# Altium project Lab4_Altium_Files.PrjPcb (part 3 of 3)

## Sheet Mem_IS43TR16256A.SchDoc
size 594 x 420 mm; SheetNumber: 9; SheetTotal: 9
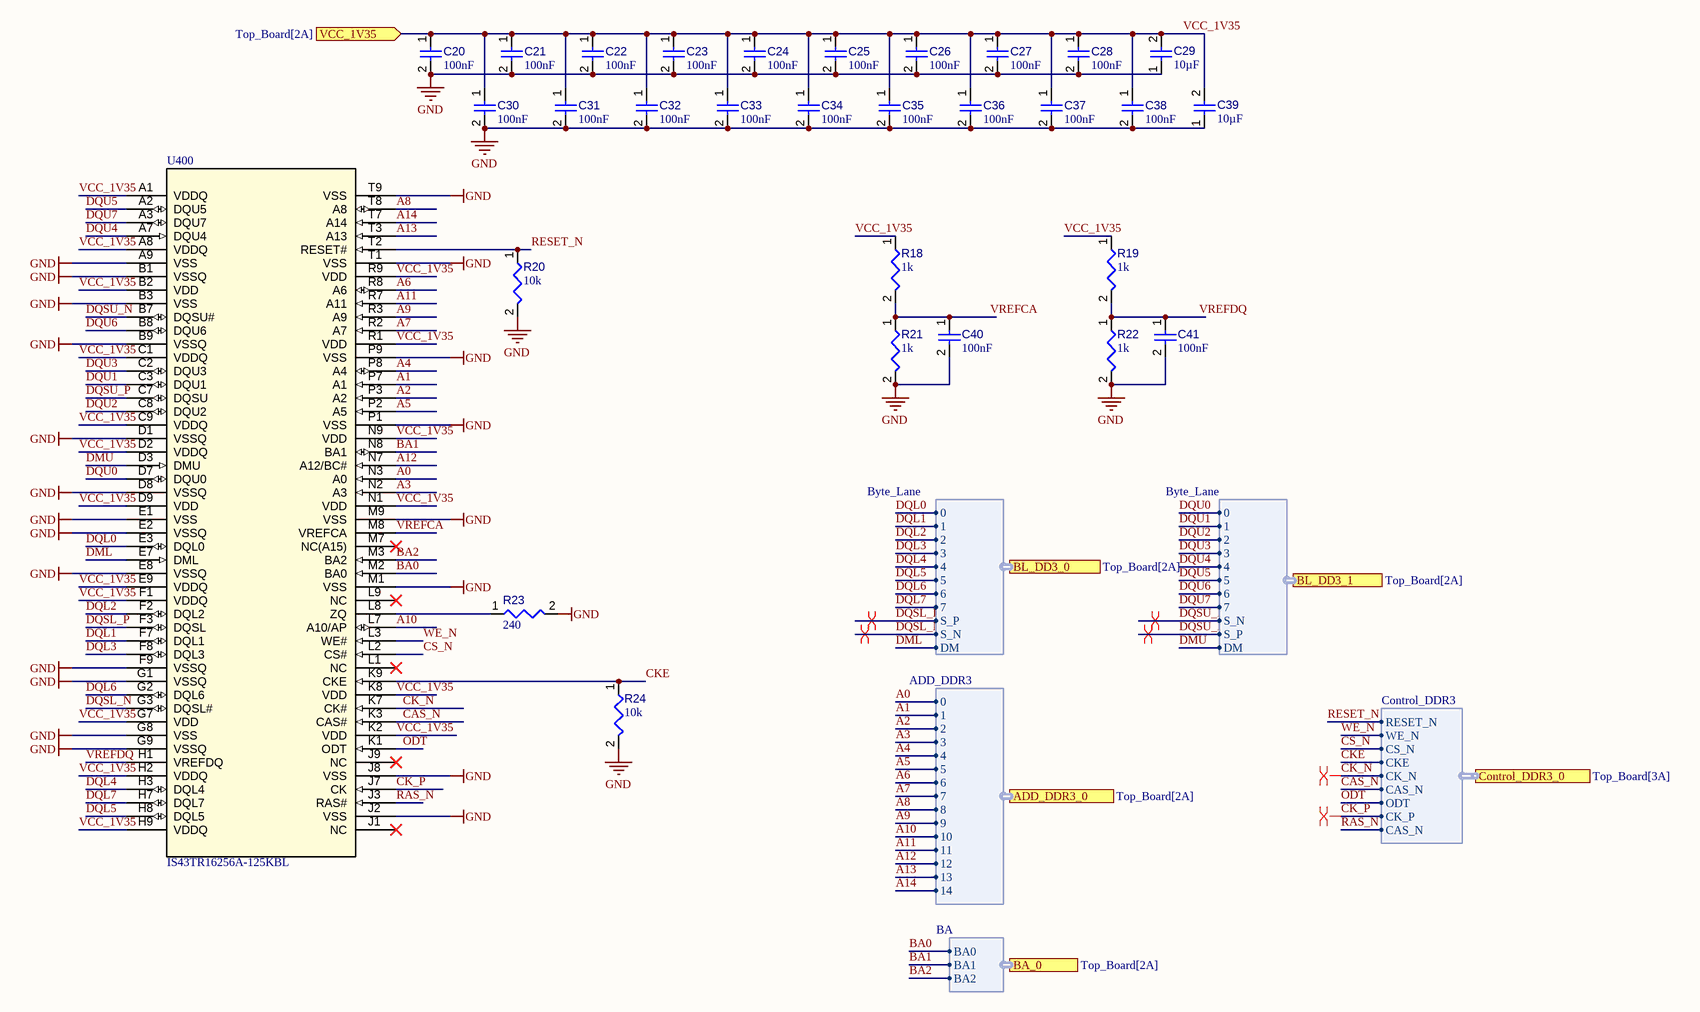
[diagram p9: Mem_IS43TR16256A.SchDoc]

### Parts
C20  value 100nF  [CAPC0402(1005)60_L]  (hidden comment: Capacitor 100nF +/-20% 50V 0402)
C21  value 100nF  [CAPC0402(1005)60_L]  (hidden comment: Capacitor 100nF +/-20% 50V 0402)
C22  value 100nF  [CAPC0402(1005)60_L]  (hidden comment: Capacitor 100nF +/-20% 50V 0402)
C23  value 100nF  [CAPC0402(1005)60_L]  (hidden comment: Capacitor 100nF +/-20% 50V 0402)
C24  value 100nF  [CAPC0402(1005)60_L]  (hidden comment: Capacitor 100nF +/-20% 50V 0402)
C25  value 100nF  [CAPC0402(1005)60_L]  (hidden comment: Capacitor 100nF +/-20% 50V 0402)
C26  value 100nF  [CAPC0402(1005)60_L]  (hidden comment: Capacitor 100nF +/-20% 50V 0402)
C27  value 100nF  [CAPC0402(1005)60_L]  (hidden comment: Capacitor 100nF +/-20% 50V 0402)
C28  value 100nF  [CAPC0402(1005)60_L]  (hidden comment: Capacitor 100nF +/-20% 50V 0402)
C29  value 10µF  [CAPC0805(2012)145_L]  (hidden comment: Capacitor 10µF +/-20% 25V 0805)
C30  value 100nF  [CAPC0402(1005)60_L]  (hidden comment: Capacitor 100nF +/-20% 50V 0402)
C31  value 100nF  [CAPC0402(1005)60_L]  (hidden comment: Capacitor 100nF +/-20% 50V 0402)
C32  value 100nF  [CAPC0402(1005)60_L]  (hidden comment: Capacitor 100nF +/-20% 50V 0402)
C33  value 100nF  [CAPC0402(1005)60_L]  (hidden comment: Capacitor 100nF +/-20% 50V 0402)
C34  value 100nF  [CAPC0402(1005)60_L]  (hidden comment: Capacitor 100nF +/-20% 50V 0402)
C35  value 100nF  [CAPC0402(1005)60_L]  (hidden comment: Capacitor 100nF +/-20% 50V 0402)
C36  value 100nF  [CAPC0402(1005)60_L]  (hidden comment: Capacitor 100nF +/-20% 50V 0402)
C37  value 100nF  [CAPC0402(1005)60_L]  (hidden comment: Capacitor 100nF +/-20% 50V 0402)
C38  value 100nF  [CAPC0402(1005)60_L]  (hidden comment: Capacitor 100nF +/-20% 50V 0402)
C39  value 10µF  [CAPC0805(2012)145_L]  (hidden comment: Capacitor 10µF +/-20% 25V 0805)
C40  value 100nF  [CAPC0402(1005)60_L]  (hidden comment: Capacitor 100nF +/-20% 50V 0402)
C41  value 100nF  [CAPC0402(1005)60_L]  (hidden comment: Capacitor 100nF +/-20% 50V 0402)
R18  value 1k  [RESC0805(2012)_L]  (hidden comment: Resistor 1K +/-5% 0805 125 mW)
R19  value 1k  [RESC0805(2012)_L]  (hidden comment: Resistor 1K +/-5% 0805 125 mW)
R20  value 10k  [RESC2013X50X35ML15T15]  (hidden comment: Resistor 10k +/-1% 0805 125 mW)
R21  value 1k  [RESC0805(2012)_L]  (hidden comment: Resistor 1K +/-5% 0805 125 mW)
R22  value 1k  [RESC0805(2012)_L]  (hidden comment: Resistor 1K +/-5% 0805 125 mW)
R23  value 240  [RESC0402(1005)_L]  (hidden comment: 240R2J)
R24  value 10k  [RESC2013X50X35ML15T15]  (hidden comment: Resistor 10k +/-1% 0805 125 mW)
U400  IS43TR16256A-125KBL  [BGA96_IS43TR_ISI]

### Ports
ADD_DDR3_0 (harness ADD_DDR3, see Top_Board[2A]), BA_0 (harness BA, see Top_Board[2A]), BL_DD3_0 (harness Byte_Lane, see Top_Board[2A]), BL_DD3_1 (harness Byte_Lane, see Top_Board[2A]), Control_DDR3_0 (harness Control_DDR3, see Top_Board[3A]), VCC_1V35 (in, see Top_Board[2A])

### Harnesses
Byte_Lane: 0, 2, 3, 4, 7, 1, 6, S_P, S_N, 5, DM
Byte_Lane: 0, 1, 2, 3, 4, 5, 6, 7, S_N, S_P, DM
ADD_DDR3: 1, 2, 3, 4, 6, 5, 7, 8, 9, 11, 10, 12, 13, 0, 14
BA: BA0, BA1, BA2
Control_DDR3: RESET_N, WE_N, CS_N, CKE, CK_N, CAS_N, ODT, CK_P, CAS_N

### Nets
GND: C20.2 C21.2 C22.2 C23.2 C24.2 C25.2 C26.2 C27.2 C28.2 C29.1 C30.2 C31.2 C32.2 C33.2 C34.2 C35.2 C36.2 C37.2 C38.2 C39.1 C40.2 C41.2 R20.2 R21.2 R22.2 R23.2 R24.2 U400.A9(VSS) U400.B1(VSSQ) U400.B3(VSS) U400.B9(VSSQ) U400.D1(VSSQ) U400.D8(VSSQ) U400.E1(VSS) U400.E2(VSSQ) U400.E8(VSSQ) U400.F9(VSSQ) U400.G1(VSSQ) U400.G8(VSS) U400.G9(VSSQ) U400.J2(VSS) U400.J8(VSS) U400.M1(VSS) U400.M9(VSS) U400.P1(VSS) U400.P9(VSS) U400.T1(VSS) U400.T9(VSS)
A0: U400.N3(A0) ; port ADD_DDR3_0.0
A1: U400.P7(A1) ; port ADD_DDR3_0.1
A2: U400.P3(A2) ; port ADD_DDR3_0.2
A3: U400.N2(A3) ; port ADD_DDR3_0.3
A4: U400.P8(A4) ; port ADD_DDR3_0.4
A5: U400.P2(A5) ; port ADD_DDR3_0.5
A6: U400.R8(A6) ; port ADD_DDR3_0.6
A7: U400.R2(A7) ; port ADD_DDR3_0.7
A8: U400.T8(A8) ; port ADD_DDR3_0.8
A9: U400.R3(A9) ; port ADD_DDR3_0.9
A10: U400.L7(A10/AP) ; port ADD_DDR3_0.10
A11: U400.R7(A11) ; port ADD_DDR3_0.11
A12: U400.N7(A12/BC#) ; port ADD_DDR3_0.12
A13: U400.T3(A13) ; port ADD_DDR3_0.13
A14: U400.T7(A14) ; port ADD_DDR3_0.14
BA0: U400.M2(BA0) ; port BA_0.BA0
BA1: U400.N8(BA1) ; port BA_0.BA1
BA2: U400.M3(BA2) ; port BA_0.BA2
CAS_N: U400.J3(RAS#) U400.K3(CAS#) ; port Control_DDR3_0.CAS_N  [also labelled RAS_N]
CK_N: U400.K7(CK#) ; port Control_DDR3_0.CK_N
CK_P: U400.J7(CK) ; port Control_DDR3_0.CK_P
CKE: R24.1 U400.K9(CKE) ; port Control_DDR3_0.CKE
CS_N: U400.L2(CS#) ; port Control_DDR3_0.CS_N  [project net Control_DDR3_A.CS_N]
DML: U400.E7(DML) ; port BL_DD3_0.DM  [project net BL_A.DM]
DMU: U400.D3(DMU) ; port BL_DD3_1.DM  [project net BL_B.DM]
DQL0: U400.E3(DQL0) ; port BL_DD3_0.0  [project net BL_A.0]
DQL1: U400.F7(DQL1) ; port BL_DD3_0.1  [project net BL_A.1]
DQL2: U400.F2(DQL2) ; port BL_DD3_0.2  [project net BL_A.2]
DQL3: U400.F8(DQL3) ; port BL_DD3_0.3  [project net BL_A.3]
DQL4: U400.H3(DQL4) ; port BL_DD3_0.4  [project net BL_A.4]
DQL5: U400.H8(DQL5) ; port BL_DD3_0.5  [project net BL_A.5]
DQL6: U400.G2(DQL6) ; port BL_DD3_0.6  [project net BL_A.6]
DQL7: U400.H7(DQL7) ; port BL_DD3_0.7  [project net BL_A.7]
DQSL_N: U400.G3(DQSL#) ; port BL_DD3_0.S_N  [project net BL_A.S_N]
DQSL_P: U400.F3(DQSL) ; port BL_DD3_0.S_P  [project net BL_A.S_P]
DQSU_N: U400.B7(DQSU#) ; port BL_DD3_1.S_P  [project net BL_B.S_P]
DQSU_P: U400.C7(DQSU) ; port BL_DD3_1.S_N  [project net BL_B.S_N]
DQU0: U400.D7(DQU0) ; port BL_DD3_1.0  [project net BL_B.0]
DQU1: U400.C3(DQU1) ; port BL_DD3_1.1  [project net BL_B.1]
DQU2: U400.C8(DQU2) ; port BL_DD3_1.2  [project net BL_B.2]
DQU3: U400.C2(DQU3) ; port BL_DD3_1.3  [project net BL_B.3]
DQU4: U400.A7(DQU4) ; port BL_DD3_1.4  [project net BL_B.4]
DQU5: U400.A2(DQU5) ; port BL_DD3_1.5  [project net BL_B.5]
DQU6: U400.B8(DQU6) ; port BL_DD3_1.6  [project net BL_B.6]
DQU7: U400.A3(DQU7) ; port BL_DD3_1.7  [project net BL_B.7]
ODT: U400.K1(ODT) ; port Control_DDR3_0.ODT  [project net Control_DDR3_A.ODT]
RESET_N: R20.1 U400.T2(RESET#) ; port Control_DDR3_0.RESET_N  [project net Control_DDR3_A.RESET_N]
VCC_1V35: C20.1 C21.1 C22.1 C23.1 C24.1 C25.1 C26.1 C27.1 C28.1 C29.2 C30.1 C31.1 C32.1 C33.1 C34.1 C35.1 C36.1 C37.1 C38.1 C39.2 R18.1 R19.1 U400.A1(VDDQ) U400.A8(VDDQ) U400.B2(VDD) U400.C1(VDDQ) U400.C9(VDDQ) U400.D2(VDDQ) U400.D9(VDD) U400.E9(VDDQ) U400.F1(VDDQ) U400.G7(VDD) U400.H2(VDDQ) U400.H9(VDDQ) U400.K2(VDD) U400.K8(VDD) U400.N1(VDD) U400.N9(VDD) U400.R1(VDD) U400.R9(VDD) ; port VCC_1V35
VREFCA: C40.1 R18.2 R21.1 U400.M8(VREFCA)
VREFDQ: C41.1 R19.2 R22.1 U400.H1(VREFDQ)
WE_N: U400.L3(WE#) ; port Control_DDR3_0.WE_N  [project net Control_DDR3_A.WE_N]
NetR23_1: R23.1 U400.L8(ZQ)

Not connected (* = marked no-connect by the designer): U400 J1(NC)* J9(NC)* L1(NC)* L9(NC)* M7(NC(A15))*

### Layout directives
differential pair: BL_A.S_N, BL_A.S_P, BL_B.S_N, BL_B.S_P, CK_N, CK_P

### Notes on the sheet
- DWG NO:
- REV:
- THIS DOCUMENT AND THE DATA DISCLOSED HEREIN OR
- HEREWITH IS THE PROPERTY OF ALTIUM LIMITED AND MAY
- BE FREELY DISTRIBUTED IN WHOLE. NO RIGHTS ARE
- RESERVED OR EXPRESS OR IMPLIED WARANTEE GIVEN.
- REVISION
- DESCRIPTION
- DATE
- APPROVED
- ENG:
- APPROVALS
- PROJECT
- DSN:
- CHK:
- REFERENCE DOCUMENTS
- PROJECT REVISION:
- TITLE
- DOCUMENT REVISION:
- DESIGN ITEM:
- BOM:
- FAB DWG:
- PCB DWG:
- ASSY DWG:
- SCALE:
- A2
- SIZE
- CAGE CODE
- FILE NAME
- DWG NO.
- SHEET
- OF
- REV

### Library data of the parts
C20-C28 C30-C38 C40 C41 = CMP-001-00067-3: Chip Capacitor, 100nF +/-20%, 50V, 0402, Thickness 0.6 mm; Manufacturer: Murata; Manufacturer Part Number: GRM155R61H104JE14D; Manufacturer: TAIYO YUDEN; Manufacturer Part Number: UMK105B7104KV-FR; Manufacturer: TDK; Manufacturer Part Number: C1005X7R1H104K; Manufacturer: Yageo Group; Manufacturer Part Number: CC0402KRX7R9BB104; Manufacturer Part Number: C1005X6S1H104K050BB; Manufacturer Part Number: CC0402KRX5R9BB104; Manufacturer Part Number: C1005X7R1H104K050BB; Manufacturer Part Number: GRM155R71H104KE14D; Manufacturer: KYOCERA AVX; Manufacturer Part Number: 04025D104KAT2A; Manufacturer Part Number: GCM155L81E104KE02D; Manufacturer Part Number: C1005X5R1H104K; Tolerance: 10%; Min Operating Temperature: -55°C; Pins: 2; Case/Package: 0402; Max Operating Temperature: 85°C; Voltage Rating: 50V; Mounting Technology: SMT; Component Type: Capacitors
C29 C39 = CMP-001-00079-4: Chip Capacitor, 10µF +/-20%, 25V, 0805, Thickness 1.45 mm; Tolerance: 10%; Max Operating Temperature: 85°C; Case/Package: 0805; Voltage Rating: 25V; Min Operating Temperature: -55°C; Mounting Technology: SMT; Pins: 2
R18 R19 R21 R22 = CMP-009-00118-3: Chip Resistor, 1 kOhms, +/-5%, 125 mW, -55 to 155 degC, 0805; Manufacturer: Yageo Group; Manufacturer Part Number: RC0805JR-071KL; Tolerance: 5%; Power: 125mW; Case/Package: 0805; Pins: 2; Min Operating Temperature: -55°C; Max Operating Temperature: 155°C; Component Type: Resistors
R20 R24 = CMP-009-00018-5: Chip Resistor, 10 KOhm, +/- 1%, 125 mW, -55 to 155 degC, 0805 (2012 Metric); Power: 125mW; Voltage Rating: 150V; Tolerance: 1%; Pins: 2; Min Operating Temperature: -55°C; Case/Package: 0805; Max Operating Temperature: 155°C; RoHS Compliant: True; Mounting Technology: SM
R23 = CMP-009-00084-2: 240R 0.063W 5% 0402 (1005 Metric)  SMD; Power: 63mW; Pins: 2; Case/Package: 0402; Mounting Technology: SMT; Tolerance: 5%
U400 = CMP-024-000001-1: No Description Available; Manufacturer_Name: ISSI; Source: IS43TR16256A-125KBL.SchLib; Copyright: Copyright (C) 2026 Ultra Librarian. All rights reserved.; Type: Memory; Design Item ID: IS43TR16256A-125KBL; Manufacturer_Part_Number: IS43TR16256A-125KBL; RefDes: RefDes

## Sheet MTFC32GAPALBH.SchDoc
size A3; SheetNumber: 7; SheetTotal: 9
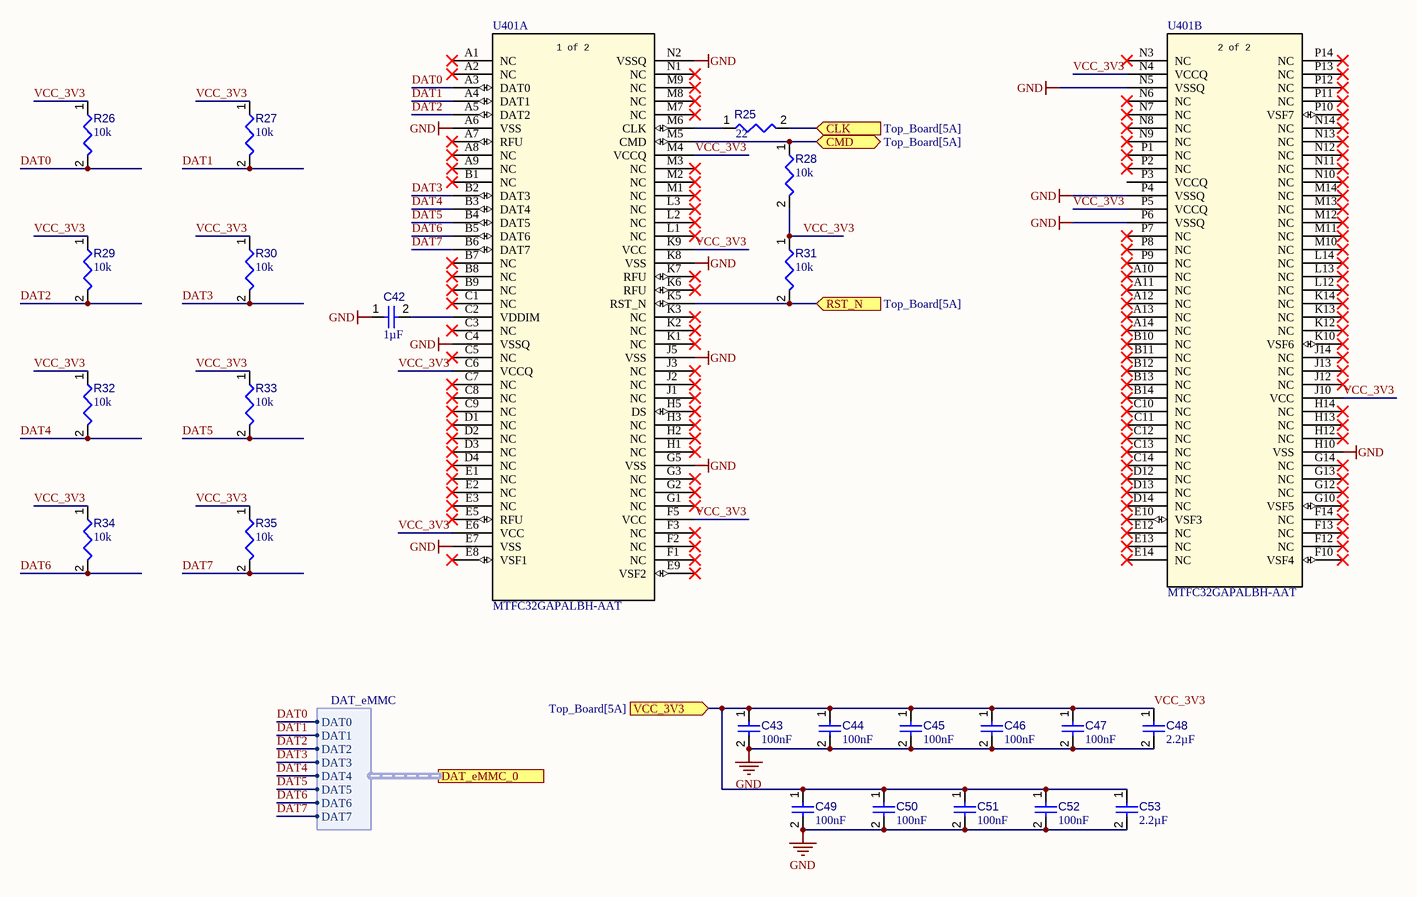
[diagram p10: MTFC32GAPALBH.SchDoc]

### Parts
C42  value 1µF  [CAPC2013X135X45NL10T25]  (hidden comment: Capacitor 1 uF +/- 10% 50 V 0805)
C43  value 100nF  [CAPC2013X95X50LL10T25]  (hidden comment: Capacitor 100 nF +/-10% 50 V 0805)
C44  value 100nF  [CAPC2013X95X50LL10T25]  (hidden comment: Capacitor 100 nF +/-10% 50 V 0805)
C45  value 100nF  [CAPC2013X95X50LL10T25]  (hidden comment: Capacitor 100 nF +/-10% 50 V 0805)
C46  value 100nF  [CAPC2013X95X50LL10T25]  (hidden comment: Capacitor 100 nF +/-10% 50 V 0805)
C47  value 100nF  [CAPC2013X95X50LL10T25]  (hidden comment: Capacitor 100 nF +/-10% 50 V 0805)
C48  value 2.2µF  [CAPC0402(1005)60_L]  (hidden comment: Capacitor 2,2µF +/-20% 10V 0402)
C49  value 100nF  [CAPC2013X95X50LL10T25]  (hidden comment: Capacitor 100 nF +/-10% 50 V 0805)
C50  value 100nF  [CAPC2013X95X50LL10T25]  (hidden comment: Capacitor 100 nF +/-10% 50 V 0805)
C51  value 100nF  [CAPC2013X95X50LL10T25]  (hidden comment: Capacitor 100 nF +/-10% 50 V 0805)
C52  value 100nF  [CAPC2013X95X50LL10T25]  (hidden comment: Capacitor 100 nF +/-10% 50 V 0805)
C53  value 2.2µF  [CAPC0402(1005)60_L]  (hidden comment: Capacitor 2,2µF +/-20% 10V 0402)
R25  value 22  [RESC0402(1005)_L]  (hidden comment: 22R2J)
R26  value 10k  [RESC2013X50X35ML15T15]  (hidden comment: Resistor 10k +/-1% 0805 125 mW)
R27  value 10k  [RESC2013X50X35ML15T15]  (hidden comment: Resistor 10k +/-1% 0805 125 mW)
R28  value 10k  [RESC2013X50X35ML15T15]  (hidden comment: Resistor 10k +/-1% 0805 125 mW)
R29  value 10k  [RESC2013X50X35ML15T15]  (hidden comment: Resistor 10k +/-1% 0805 125 mW)
R30  value 10k  [RESC2013X50X35ML15T15]  (hidden comment: Resistor 10k +/-1% 0805 125 mW)
R31  value 10k  [RESC2013X50X35ML15T15]  (hidden comment: Resistor 10k +/-1% 0805 125 mW)
R32  value 10k  [RESC2013X50X35ML15T15]  (hidden comment: Resistor 10k +/-1% 0805 125 mW)
R33  value 10k  [RESC2013X50X35ML15T15]  (hidden comment: Resistor 10k +/-1% 0805 125 mW)
R34  value 10k  [RESC2013X50X35ML15T15]  (hidden comment: Resistor 10k +/-1% 0805 125 mW)
R35  value 10k  [RESC2013X50X35ML15T15]  (hidden comment: Resistor 10k +/-1% 0805 125 mW)
U401  MTFC32GAPALBH-AAT  [TFBGA153_11P5X13_MRN]  (parts A,B of 2)

### Ports
CLK (in, see Top_Board[5A]), CMD (bidir, see Top_Board[5A]), DAT_eMMC_0 (harness DAT_eMMC), RST_N (in, see Top_Board[5A]), VCC_3V3 (in, see Top_Board[5A])

### Harnesses
DAT_eMMC: DAT0, DAT1, DAT2, DAT3, DAT5, DAT6, DAT7, DAT4

### Nets
GND: C42.1 C43.2 C44.2 C45.2 C46.2 C47.2 C48.2 C49.2 C50.2 C51.2 C52.2 C53.2 U401.A6(VSS) U401.C4(VSSQ) U401.E7(VSS) U401.G5(VSS) U401.H10(VSS) U401.J5(VSS) U401.K8(VSS) U401.N2(VSSQ) U401.N5(VSSQ) U401.P4(VSSQ) U401.P6(VSSQ)
DAT0: R26.2 U401.A3(DAT0) ; port DAT_eMMC_0.DAT0
DAT1: R27.2 U401.A4(DAT1) ; port DAT_eMMC_0.DAT1
DAT2: R29.2 U401.A5(DAT2) ; port DAT_eMMC_0.DAT2
DAT3: R30.2 U401.B2(DAT3) ; port DAT_eMMC_0.DAT3
DAT4: R32.2 U401.B3(DAT4) ; port DAT_eMMC_0.DAT4
DAT5: R33.2 U401.B4(DAT5) ; port DAT_eMMC_0.DAT5
DAT6: R34.2 U401.B5(DAT6) ; port DAT_eMMC_0.DAT6
DAT7: R35.2 U401.B6(DAT7) ; port DAT_eMMC_0.DAT7
eMMC_CLK: R25.2 ; port CLK
eMMC_CMD: R28.1 U401.M5(CMD) ; port CMD
RST_N: R31.2 U401.K5(RST_N) ; port RST_N
VCC_3V3: C43.1 C44.1 C45.1 C46.1 C47.1 C48.1 C49.1 C50.1 C51.1 C52.1 C53.1 R26.1 R27.1 R28.2 R29.1 R30.1 R31.1 R32.1 R33.1 R34.1 R35.1 U401.C6(VCCQ) U401.E6(VCC) U401.F5(VCC) U401.J10(VCC) U401.K9(VCC) U401.M4(VCCQ) U401.N4(VCCQ) U401.P5(VCCQ) ; port VCC_3V3
NetC42_2: C42.2 U401.C2(VDDIM)
NetR25_1: R25.1 U401.M6(CLK)

Not connected (* = marked no-connect by the designer): U401 A1(NC)* A2(NC)* A7(RFU)* A8(NC)* A9(NC)* A10(NC)* A11(NC)* A12(NC)* A13(NC)* A14(NC)* B1(NC)* B7(NC)* B8(NC)* B9(NC)* B10(NC)* B11(NC)* B12(NC)* B13(NC)* B14(NC)* C1(NC)* C3(NC)* C5(NC)* C7(NC)* C8(NC)* C9(NC)* C10(NC)* C11(NC)* C12(NC)* C13(NC)* C14(NC)* D1(NC)* D2(NC)* D3(NC)* D4(NC)* D12(NC)* D13(NC)* D14(NC)* E1(NC)* E2(NC)* E3(NC)* E5(RFU)* E8(VSF1)* E9(VSF2)* E10(VSF3)* E12(NC)* E13(NC)* E14(NC)* F1(NC)* F2(NC)* F3(NC)* F10(VSF4)* F12(NC)* F13(NC)* F14(NC)* G1(NC)* G2(NC)* G3(NC)* G10(VSF5)* G12(NC)* G13(NC)* G14(NC)* H1(NC)* H2(NC)* H3(NC)* H5(DS)* H12(NC)* H13(NC)* H14(NC)* J1(NC)* J2(NC)* J3(NC)* J12(NC)* J13(NC)* J14(NC)* K1(NC)* K2(NC)* K3(NC)* K6(RFU)* K7(RFU)* K10(VSF6)* K12(NC)* K13(NC)* K14(NC)* L1(NC)* L2(NC)* L3(NC)* L12(NC)* L13(NC)* L14(NC)* M1(NC)* M2(NC)* M3(NC)* M7(NC)* M8(NC)* M9(NC)* M10(NC)* M11(NC)* M12(NC)* M13(NC)* M14(NC)* N1(NC)* N3(NC)* N6(NC)* N7(NC)* N8(NC)* N9(NC)* N10(NC)* N11(NC)* N12(NC)* N13(NC)* N14(NC)* P1(NC)* P2(NC)* P3(VCCQ) P7(NC)* P8(NC)* P9(NC)* P10(VSF7)* P11(NC)* P12(NC)* P13(NC)* P14(NC)*

### Notes on the sheet
- (in symbol CMP-034-000000-1, part A) 1 of 2
- (in symbol CMP-034-000000-1, part B) 2 of 2

### Library data of the parts
C42 = CMP-001-00007-6: Chip Capacitor, 1 uF, +/- 10%, 50 V, 0805 (2012 Metric); Manufacturer: TDK; Manufacturer Part Number: C2012X7R1H105K125AB; Manufacturer: Murata; Manufacturer Part Number: GRM21BR71H105KA12L; Manufacturer: Kyocera / AVX; Manufacturer Part Number: 08055C105KAT2A; Capacitor Type: Ceramic; Voltage Rating: 50V; Min Operating Temperature: -55°C; RoHS Compliant: True; Mounting Technology: SM; Case/Package: 0805; Max Operating Temperature: 125°C; Tolerance: 10%; Pins: 2; Component Type: Capacitors
C43-C47 C49-C52 = CMP-001-00018-6: Chip Capacitor, 100 nF, +/- 10%, 50 V, 0805 (2012 Metric); Manufacturer: Yageo Group; Manufacturer Part Number: CC0805KRX7R9BB104; Manufacturer: Murata; Manufacturer Part Number: GRM21BR71H104KA01L; Capacitor Type: Ceramic; Voltage Rating: 50V; Pins: 2; Max Operating Temperature: 125°C; Min Operating Temperature: -55°C; Mounting Technology: SM; Case/Package: 0805; RoHS Compliant: True; Tolerance: 10%; Component Type: Capacitors
C48 C53 = CMP-001-00056-4: Chip Capacitor, 2,2µF +/-20%, 10V, 0402, Thickness 0.6 mm; Manufacturer: Samsung Electro-Mechanics; Manufacturer Part Number: CL05A225KP7NSB8; Manufacturer: Murata; Manufacturer Part Number: GRM155R61C225KE11D; Manufacturer: TDK; Manufacturer Part Number: C1005X5R1A225K; Manufacturer Part Number: GRM155R61A225KE95D; Manufacturer Part Number: GRM155R61C225KE44D; Manufacturer Part Number: GRT155R61E225KE13D; Tolerance: 10%; Mounting Technology: SMT; Max Operating Temperature: 85°C; Case/Package: 0402; Pins: 2; Min Operating Temperature: -55°C; Voltage Rating: 10V; Component Type: Capacitors
R25 = CMP-009-00082-2: 22R 0.063W 5% 0402 (1005 Metric)  SMD; Power: 63mW; Tolerance: 5%; Case/Package: 0402; Pins: 2; Mounting Technology: SMT
R26-R35 = CMP-009-00018-5: Chip Resistor, 10 KOhm, +/- 1%, 125 mW, -55 to 155 degC, 0805 (2012 Metric); Manufacturer: Yageo Group; Manufacturer Part Number: RC0805FR-0710KL; Manufacturer: Vishay; Manufacturer Part Number: CRCW080510K0FKEA; Manufacturer: Panasonic / Panasonic ECG; Manufacturer Part Number: ERJ-6ENF1002V; Power: 125mW; Voltage Rating: 150V; Tolerance: 1%; Pins: 2; Min Operating Temperature: -55°C; Case/Package: 0805; Max Operating Temperature: 155°C; RoHS Compliant: True; Mounting Technology: SM; Component Type: Resistors
U401 = CMP-034-000000-1: No Description Available; Manufacturer_Name: Micron; Copyright: Copyright (C) 2026 Ultra Librarian. All rights reserved.; Type: Type; Manufacturer_Part_Number: MTFC32GAPALBH-AAT; RefDes: RefDes; Design Item ID: MTFC32GAPALBH-AAT; Source: MTFC32GAPALBH-AAT.SchLib

## Sheet MR4A16BCYS35R.SchDoc
size A3; SheetNumber: 6; SheetTotal: 10
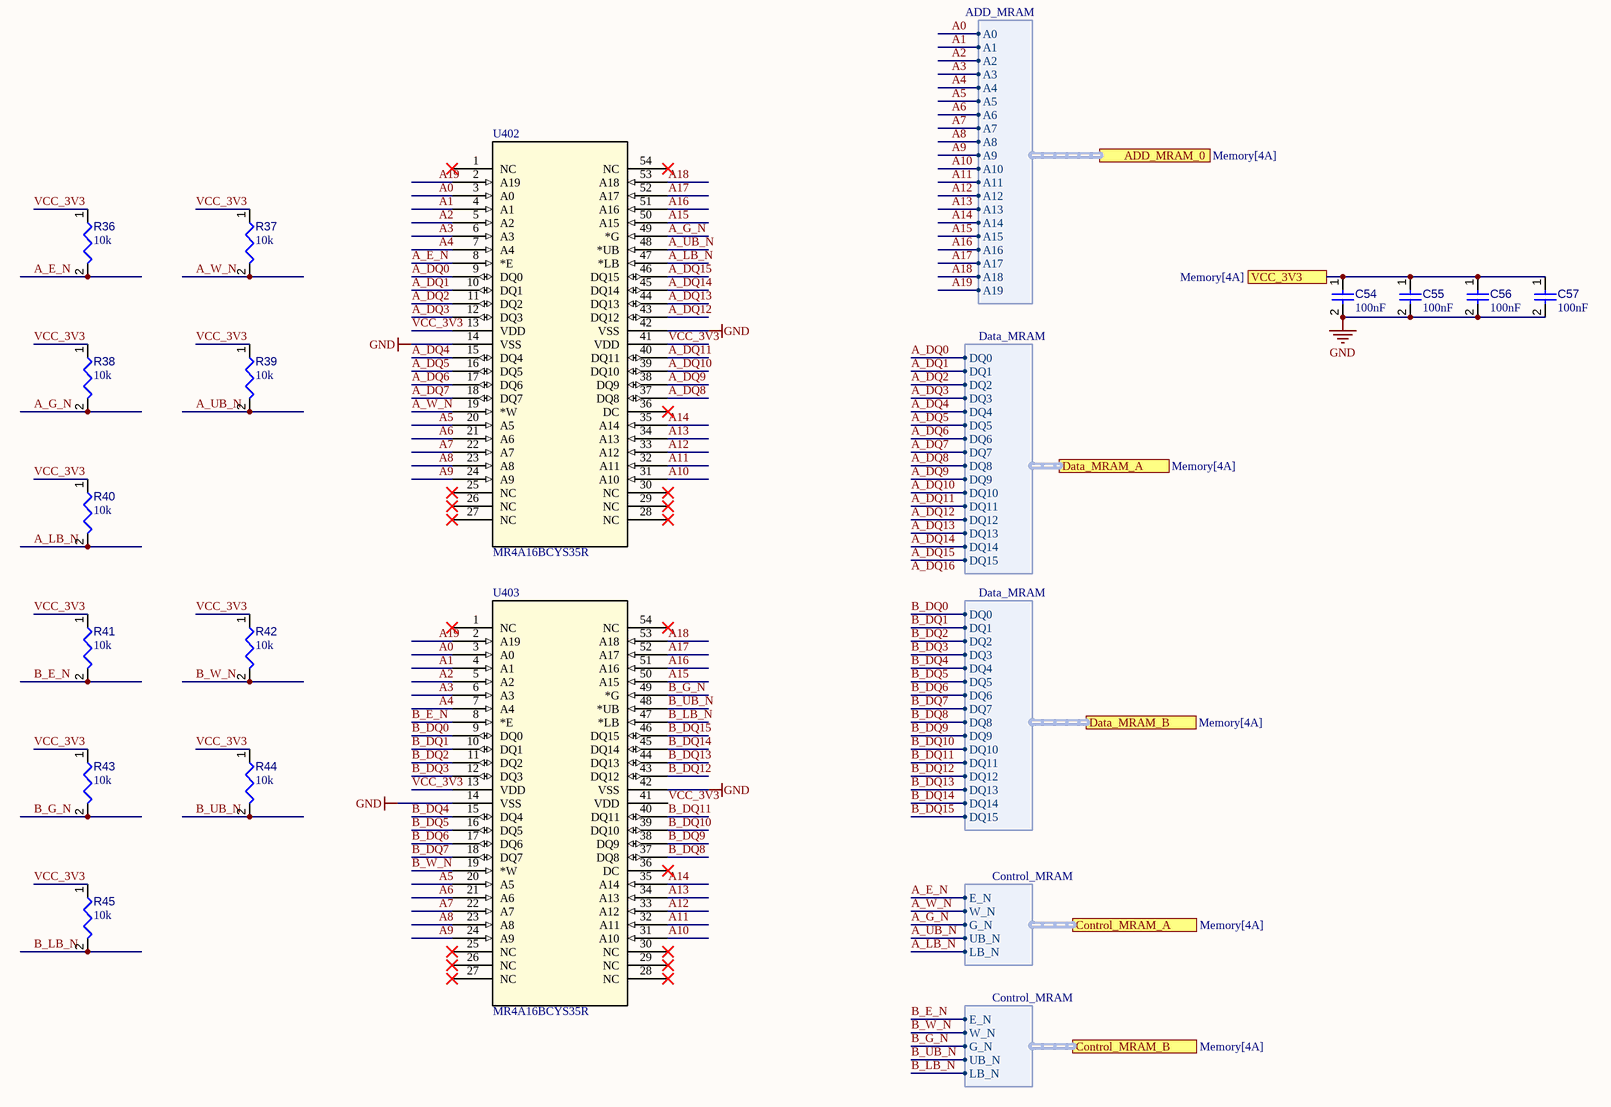
[diagram p11: MR4A16BCYS35R.SchDoc]

### Parts
C54  value 100nF  [CAPC2013X95X50LL10T25]  (hidden comment: Capacitor 100 nF +/-10% 50 V 0805)
C55  value 100nF  [CAPC2013X95X50LL10T25]  (hidden comment: Capacitor 100 nF +/-10% 50 V 0805)
C56  value 100nF  [CAPC2013X95X50LL10T25]  (hidden comment: Capacitor 100 nF +/-10% 50 V 0805)
C57  value 100nF  [CAPC2013X95X50LL10T25]  (hidden comment: Capacitor 100 nF +/-10% 50 V 0805)
R36  value 10k  [RESC2013X50X35ML15T15]  (hidden comment: Resistor 10k +/-1% 0805 125 mW)
R37  value 10k  [RESC2013X50X35ML15T15]  (hidden comment: Resistor 10k +/-1% 0805 125 mW)
R38  value 10k  [RESC2013X50X35ML15T15]  (hidden comment: Resistor 10k +/-1% 0805 125 mW)
R39  value 10k  [RESC2013X50X35ML15T15]  (hidden comment: Resistor 10k +/-1% 0805 125 mW)
R40  value 10k  [RESC2013X50X35ML15T15]  (hidden comment: Resistor 10k +/-1% 0805 125 mW)
R41  value 10k  [RESC2013X50X35ML15T15]  (hidden comment: Resistor 10k +/-1% 0805 125 mW)
R42  value 10k  [RESC2013X50X35ML15T15]  (hidden comment: Resistor 10k +/-1% 0805 125 mW)
R43  value 10k  [RESC2013X50X35ML15T15]  (hidden comment: Resistor 10k +/-1% 0805 125 mW)
R44  value 10k  [RESC2013X50X35ML15T15]  (hidden comment: Resistor 10k +/-1% 0805 125 mW)
R45  value 10k  [RESC2013X50X35ML15T15]  (hidden comment: Resistor 10k +/-1% 0805 125 mW)
U402  MR4A16BCYS35R  [TSOP2-54_EVS]
U403  MR4A16BCYS35R  [TSOP2-54_EVS]

### Ports
ADD_MRAM_0 (harness ADD_MRAM, see Memory[4A]), Control_MRAM_A (harness Control_MRAM, see Memory[4A]), Control_MRAM_B (harness Control_MRAM, see Memory[4A]), Data_MRAM_A (harness Data_MRAM, see Memory[4A]), Data_MRAM_B (harness Data_MRAM, see Memory[4A]), VCC_3V3 (see Memory[4A])

### Harnesses
ADD_MRAM: A0, A1, A2, A3, A4, A5, A6, A7, A8, A9, A10, A11, A12, A13, A14, A15, A16, A17, A18, A19
Data_MRAM: DQ0, DQ1, DQ2, DQ3, DQ4, DQ5, DQ6, DQ7, DQ8, DQ9, DQ10, DQ11, DQ12, DQ13, DQ14, DQ15
Control_MRAM: E_N, W_N, G_N, LB_N, UB_N

### Nets
GND: C54.2 C55.2 C56.2 C57.2 U402.14(VSS) U402.42(VSS) U403.14(VSS) U403.42(VSS)
A0: U402.3(A0) U403.3(A0) ; port ADD_MRAM_0.A0
A1: U402.4(A1) U403.4(A1) ; port ADD_MRAM_0.A1
A2: U402.5(A2) U403.5(A2) ; port ADD_MRAM_0.A2
A3: U402.6(A3) U403.6(A3) ; port ADD_MRAM_0.A3
A4: U402.7(A4) U403.7(A4) ; port ADD_MRAM_0.A4
A5: U402.20(A5) U403.20(A5) ; port ADD_MRAM_0.A5
A6: U402.21(A6) U403.21(A6) ; port ADD_MRAM_0.A6
A7: U402.22(A7) U403.22(A7) ; port ADD_MRAM_0.A7
A8: U402.23(A8) U403.23(A8) ; port ADD_MRAM_0.A8
A9: U402.24(A9) U403.24(A9) ; port ADD_MRAM_0.A9
A10: U402.31(A10) U403.31(A10) ; port ADD_MRAM_0.A10
A11: U402.32(A11) U403.32(A11) ; port ADD_MRAM_0.A11
A12: U402.33(A12) U403.33(A12) ; port ADD_MRAM_0.A12
A13: U402.34(A13) U403.34(A13) ; port ADD_MRAM_0.A13
A14: U402.35(A14) U403.35(A14) ; port ADD_MRAM_0.A14
A15: U402.50(A15) U403.50(A15) ; port ADD_MRAM_0.A15
A16: U402.51(A16) U403.51(A16) ; port ADD_MRAM_0.A16
A17: U402.52(A17) U403.52(A17) ; port ADD_MRAM_0.A17
A18: U402.53(A18) U403.53(A18) ; port ADD_MRAM_0.A18
A19: U402.2(A19) U403.2(A19) ; port ADD_MRAM_0.A19
A_DQ0: U402.9(DQ0) ; port Data_MRAM_A.DQ0
A_DQ1: U402.10(DQ1) ; port Data_MRAM_A.DQ1
A_DQ2: U402.11(DQ2) ; port Data_MRAM_A.DQ2
A_DQ3: U402.12(DQ3) ; port Data_MRAM_A.DQ3
A_DQ4: U402.15(DQ4) ; port Data_MRAM_A.DQ4
A_DQ5: U402.16(DQ5) ; port Data_MRAM_A.DQ5
A_DQ6: U402.17(DQ6) ; port Data_MRAM_A.DQ6
A_DQ7: U402.18(DQ7) ; port Data_MRAM_A.DQ7
A_DQ8: U402.37(DQ8) ; port Data_MRAM_A.DQ8
A_DQ9: U402.38(DQ9) ; port Data_MRAM_A.DQ9
A_DQ10: U402.39(DQ10) ; port Data_MRAM_A.DQ10
A_DQ11: U402.40(DQ11) ; port Data_MRAM_A.DQ11
A_DQ12: U402.43(DQ12) ; port Data_MRAM_A.DQ12
A_DQ13: U402.44(DQ13) ; port Data_MRAM_A.DQ13
A_DQ14: U402.45(DQ14) ; port Data_MRAM_A.DQ14
A_DQ15: U402.46(DQ15) ; port Data_MRAM_A.DQ15
A_E_N: R36.2 R41.2 U402.8(*E) U403.8(*E) ; port Control_MRAM_A.E_N  [also labelled B_E_N]
A_G_N: R38.2 R43.2 U402.49(*G) U403.49(*G) ; port Control_MRAM_A.G_N  [also labelled B_G_N]
A_LB_N: R40.2 R45.2 U402.47(*LB) U403.47(*LB) ; port Control_MRAM_A.LB_N  [also labelled B_LB_N]
A_UB_N: R39.2 R44.2 U402.48(*UB) U403.48(*UB) ; port Control_MRAM_A.UB_N  [also labelled B_UB_N]
A_W_N: R37.2 R42.2 U402.19(*W) U403.19(*W) ; port Control_MRAM_A.W_N  [also labelled B_W_N]
B_DQ0: U403.9(DQ0) ; port Data_MRAM_B.DQ0
B_DQ1: U403.10(DQ1) ; port Data_MRAM_B.DQ1
B_DQ2: U403.11(DQ2) ; port Data_MRAM_B.DQ2
B_DQ3: U403.12(DQ3) ; port Data_MRAM_B.DQ3
B_DQ4: U403.15(DQ4) ; port Data_MRAM_B.DQ4
B_DQ5: U403.16(DQ5) ; port Data_MRAM_B.DQ5
B_DQ6: U403.17(DQ6) ; port Data_MRAM_B.DQ6
B_DQ7: U403.18(DQ7) ; port Data_MRAM_B.DQ7
B_DQ8: U403.37(DQ8) ; port Data_MRAM_B.DQ8
B_DQ9: U403.38(DQ9) ; port Data_MRAM_B.DQ9
B_DQ10: U403.39(DQ10) ; port Data_MRAM_B.DQ10
B_DQ11: U403.40(DQ11) ; port Data_MRAM_B.DQ11
B_DQ12: U403.43(DQ12) ; port Data_MRAM_B.DQ12
B_DQ13: U403.44(DQ13) ; port Data_MRAM_B.DQ13
B_DQ14: U403.45(DQ14) ; port Data_MRAM_B.DQ14
B_DQ15: U403.46(DQ15) ; port Data_MRAM_B.DQ15
VCC_3V3: R36.1 R37.1 R38.1 R39.1 R40.1 R41.1 R42.1 R43.1 R44.1 R45.1 U402.13(VDD) U402.41(VDD) U403.13(VDD) U403.41(VDD)
NetC54_1: C54.1 C55.1 C56.1 C57.1 ; port VCC_3V3

Not connected (* = marked no-connect by the designer): U402 1(NC)* 25(NC)* 26(NC)* 27(NC)* 28(NC)* 29(NC)* 30(NC)* 36(DC)* 54(NC)*; U403 1(NC)* 25(NC)* 26(NC)* 27(NC)* 28(NC)* 29(NC)* 30(NC)* 36(DC)* 54(NC)*

### Notes on the sheet
- Labels drawn without touching a wire or pin: A_DQ16

### Library data of the parts
C54-C57 = CMP-001-00018-6: Chip Capacitor, 100 nF, +/- 10%, 50 V, 0805 (2012 Metric); Capacitor Type: Ceramic; Voltage Rating: 50V; Pins: 2; Max Operating Temperature: 125°C; Min Operating Temperature: -55°C; Mounting Technology: SM; Case/Package: 0805; RoHS Compliant: True; Tolerance: 10%
R36-R45 = CMP-009-00018-5: as R26 on sheet MTFC32GAPALBH; Tolerance: 1%; Pins: 2; Min Operating Temperature: -55°C; Case/Package: 0805; Max Operating Temperature: 155°C; RoHS Compliant: True; Mounting Technology: SM; Component Type: Resistors
U402 U403 = CMP-022-000000-1: No Description Available; Manufacturer_Name: Everspin; Copyright: Copyright (C) 2026 Ultra Librarian. All rights reserved.; Type: Type; Manufacturer_Part_Number: MR4A16BCYS35R; RefDes: RefDes; Design Item ID: MR4A16BCYS35R; Source: MR4A16BCYS35R.SchLib

## Nets that join several sheets
GND: Soc_SmartFusion2 (11 pins), UHF (32 pins), S_Band (96 pins), Power (35 pins), Mem_IS43TR16256A (48 pins), MTFC32GAPALBH (23 pins), MR4A16BCYS35R (8 pins)
A0: Soc_SmartFusion2 (U16.B17), Mem_IS43TR16256A (U400.N3)
A0: Soc_SmartFusion2 (U16.D1), MR4A16BCYS35R (U402.3 U403.3)
A1: Soc_SmartFusion2 (U16.D2), MR4A16BCYS35R (U402.4 U403.4)
A1: Soc_SmartFusion2 (U16.D16), Mem_IS43TR16256A (U400.P7)
A2: Soc_SmartFusion2 (U16.D3), MR4A16BCYS35R (U402.5 U403.5)
A2: Soc_SmartFusion2 (U16.E16), Mem_IS43TR16256A (U400.P3)
A3: Soc_SmartFusion2 (U16.C17), Mem_IS43TR16256A (U400.N2)
A3: Soc_SmartFusion2 (U16.D4), MR4A16BCYS35R (U402.6 U403.6)
A4: Soc_SmartFusion2 (U16.C18), Mem_IS43TR16256A (U400.P8)
A4: Soc_SmartFusion2 (U16.D5), MR4A16BCYS35R (U402.7 U403.7)
A5: Soc_SmartFusion2 (U16.B19), Mem_IS43TR16256A (U400.P2)
A5: Soc_SmartFusion2 (U16.E1), MR4A16BCYS35R (U402.20 U403.20)
A6: Soc_SmartFusion2 (U16.A20), Mem_IS43TR16256A (U400.R8)
A6: Soc_SmartFusion2 (U16.E2), MR4A16BCYS35R (U402.21 U403.21)
A7: Soc_SmartFusion2 (U16.C19), Mem_IS43TR16256A (U400.R2)
A7: Soc_SmartFusion2 (U16.E4), MR4A16BCYS35R (U402.22 U403.22)
A8: Soc_SmartFusion2 (U16.E5), MR4A16BCYS35R (U402.23 U403.23)
A8: Soc_SmartFusion2 (U16.E17), Mem_IS43TR16256A (U400.T8)
A9: Soc_SmartFusion2 (U16.C4), MR4A16BCYS35R (U402.24 U403.24)
A9: Soc_SmartFusion2 (U16.F17), Mem_IS43TR16256A (U400.R3)
A10: Soc_SmartFusion2 (U16.A21), Mem_IS43TR16256A (U400.L7)
A10: Soc_SmartFusion2 (U16.C3), MR4A16BCYS35R (U402.31 U403.31)
A11: Soc_SmartFusion2 (U16.B3), MR4A16BCYS35R (U402.32 U403.32)
A11: Soc_SmartFusion2 (U16.B21), Mem_IS43TR16256A (U400.R7)
A12: Soc_SmartFusion2 (U16.B2), MR4A16BCYS35R (U402.33 U403.33)
A12: Soc_SmartFusion2 (U16.E19), Mem_IS43TR16256A (U400.N7)
A13: Soc_SmartFusion2 (U16.A2), MR4A16BCYS35R (U402.34 U403.34)
A13: Soc_SmartFusion2 (U16.D20), Mem_IS43TR16256A (U400.T3)
A14: Soc_SmartFusion2 (U16.C1), MR4A16BCYS35R (U402.35 U403.35)
A14: Soc_SmartFusion2 (U16.D18), Mem_IS43TR16256A (U400.T7)
A15: Soc_SmartFusion2 (U16.B1), MR4A16BCYS35R (U402.50 U403.50)
A16: Soc_SmartFusion2 (U16.F6), MR4A16BCYS35R (U402.51 U403.51)
A17: Soc_SmartFusion2 (U16.F5), MR4A16BCYS35R (U402.52 U403.52)
A18: Soc_SmartFusion2 (U16.F4), MR4A16BCYS35R (U402.53 U403.53)
A19: Soc_SmartFusion2 (U16.F3), MR4A16BCYS35R (U402.2 U403.2)
A_DQ0: Soc_SmartFusion2 (U16.L21), MR4A16BCYS35R (U402.9)
A_DQ1: Soc_SmartFusion2 (U16.L20), MR4A16BCYS35R (U402.10)
A_DQ2: Soc_SmartFusion2 (U16.L19), MR4A16BCYS35R (U402.11)
A_DQ3: Soc_SmartFusion2 (U16.L18), MR4A16BCYS35R (U402.12)
A_DQ4: Soc_SmartFusion2 (U16.L16), MR4A16BCYS35R (U402.15)
A_DQ5: Soc_SmartFusion2 (U16.K21), MR4A16BCYS35R (U402.16)
A_DQ6: Soc_SmartFusion2 (U16.K20), MR4A16BCYS35R (U402.17)
A_DQ7: Soc_SmartFusion2 (U16.K18), MR4A16BCYS35R (U402.18)
A_DQ8: Soc_SmartFusion2 (U16.K17), MR4A16BCYS35R (U402.37)
A_DQ9: Soc_SmartFusion2 (U16.K16), MR4A16BCYS35R (U402.38)
A_DQ10: Soc_SmartFusion2 (U16.K15), MR4A16BCYS35R (U402.39)
A_DQ11: Soc_SmartFusion2 (U16.J18), MR4A16BCYS35R (U402.40)
A_DQ12: Soc_SmartFusion2 (U16.M16), MR4A16BCYS35R (U402.43)
A_DQ13: Soc_SmartFusion2 (U16.M17), MR4A16BCYS35R (U402.44)
A_DQ14: Soc_SmartFusion2 (U16.M18), MR4A16BCYS35R (U402.45)
A_DQ15: Soc_SmartFusion2 (U16.M19), MR4A16BCYS35R (U402.46)
A_E_N: Soc_SmartFusion2 (U16.R18), MR4A16BCYS35R (R36.2 R41.2 U402.8 U403.8)
A_G_N: Soc_SmartFusion2 (U16.R16), MR4A16BCYS35R (R38.2 R43.2 U402.49 U403.49)
A_LB_N: Soc_SmartFusion2 (U16.P17), MR4A16BCYS35R (R40.2 R45.2 U402.47 U403.47)
A_UB_N: Soc_SmartFusion2 (U16.P18), MR4A16BCYS35R (R39.2 R44.2 U402.48 U403.48)
A_W_N: Soc_SmartFusion2 (U16.R17), MR4A16BCYS35R (R37.2 R42.2 U402.19 U403.19)
B_DQ0: Soc_SmartFusion2 (U16.M21), MR4A16BCYS35R (U403.9)
B_DQ1: Soc_SmartFusion2 (U16.M22), MR4A16BCYS35R (U403.10)
B_DQ2: Soc_SmartFusion2 (U16.N16), MR4A16BCYS35R (U403.11)
B_DQ3: Soc_SmartFusion2 (U16.N17), MR4A16BCYS35R (U403.12)
B_DQ4: Soc_SmartFusion2 (U16.N19), MR4A16BCYS35R (U403.15)
B_DQ5: Soc_SmartFusion2 (U16.N20), MR4A16BCYS35R (U403.16)
B_DQ6: Soc_SmartFusion2 (U16.N21), MR4A16BCYS35R (U403.17)
B_DQ7: Soc_SmartFusion2 (U16.N22), MR4A16BCYS35R (U403.18)
B_DQ8: Soc_SmartFusion2 (U16.T18), MR4A16BCYS35R (U403.37)
B_DQ9: Soc_SmartFusion2 (U16.T19), MR4A16BCYS35R (U403.38)
B_DQ10: Soc_SmartFusion2 (U16.T20), MR4A16BCYS35R (U403.39)
B_DQ11: Soc_SmartFusion2 (U16.T21), MR4A16BCYS35R (U403.40)
B_DQ12: Soc_SmartFusion2 (U16.U19), MR4A16BCYS35R (U403.43)
B_DQ13: Soc_SmartFusion2 (U16.U21), MR4A16BCYS35R (U403.44)
B_DQ14: Soc_SmartFusion2 (U16.U22), MR4A16BCYS35R (U403.45)
B_DQ15: Soc_SmartFusion2 (U16.V22), MR4A16BCYS35R (U403.46)
BA0: Soc_SmartFusion2 (U16.A18), Mem_IS43TR16256A (U400.M2)
BA1: Soc_SmartFusion2 (U16.A19), Mem_IS43TR16256A (U400.N8)
BA2: Soc_SmartFusion2 (U16.C16), Mem_IS43TR16256A (U400.M3)
BL_A.0: Soc_SmartFusion2 (U16.B9), Mem_IS43TR16256A (U400.E3)
BL_A.1: Soc_SmartFusion2 (U16.A9), Mem_IS43TR16256A (U400.F7)
BL_A.2: Soc_SmartFusion2 (U16.F10), Mem_IS43TR16256A (U400.F2)
BL_A.3: Soc_SmartFusion2 (U16.E10), Mem_IS43TR16256A (U400.F8)
BL_A.4: Soc_SmartFusion2 (U16.A11), Mem_IS43TR16256A (U400.H3)
BL_A.5: Soc_SmartFusion2 (U16.D10), Mem_IS43TR16256A (U400.H8)
BL_A.6: Soc_SmartFusion2 (U16.D11), Mem_IS43TR16256A (U400.G2)
BL_A.7: Soc_SmartFusion2 (U16.E12), Mem_IS43TR16256A (U400.H7)
BL_A.DM: Soc_SmartFusion2 (U16.A10), Mem_IS43TR16256A (U400.E7)
BL_A.S_N: Soc_SmartFusion2 (U16.C11), Mem_IS43TR16256A (U400.G3)
BL_A.S_P: Soc_SmartFusion2 (U16.B11), Mem_IS43TR16256A (U400.F3)
BL_B.0: Soc_SmartFusion2 (U16.A12), Mem_IS43TR16256A (U400.D7)
BL_B.1: Soc_SmartFusion2 (U16.A13), Mem_IS43TR16256A (U400.C3)
BL_B.2: Soc_SmartFusion2 (U16.D12), Mem_IS43TR16256A (U400.C8)
BL_B.3: Soc_SmartFusion2 (U16.D13), Mem_IS43TR16256A (U400.C2)
BL_B.4: Soc_SmartFusion2 (U16.A14), Mem_IS43TR16256A (U400.A7)
BL_B.5: Soc_SmartFusion2 (U16.A15), Mem_IS43TR16256A (U400.A2)
BL_B.6: Soc_SmartFusion2 (U16.D14), Mem_IS43TR16256A (U400.B8)
BL_B.7: Soc_SmartFusion2 (U16.E13), Mem_IS43TR16256A (U400.A3)
BL_B.DM: Soc_SmartFusion2 (U16.G13), Mem_IS43TR16256A (U400.D3)
BL_B.S_N: Soc_SmartFusion2 (U16.B13), Mem_IS43TR16256A (U400.C7)
BL_B.S_P: Soc_SmartFusion2 (U16.C13), Mem_IS43TR16256A (U400.B7)
CAS_N: Soc_SmartFusion2 (U16.F14 U16.F15), Mem_IS43TR16256A (U400.J3 U400.K3)
CKE: Soc_SmartFusion2 (U16.B15), Mem_IS43TR16256A (R24.1 U400.K9)
Control_DDR3_A.CS_N: Soc_SmartFusion2 (U16.C15), Mem_IS43TR16256A (U400.L2)
Control_DDR3_A.ODT: Soc_SmartFusion2 (U16.C20), Mem_IS43TR16256A (U400.K1)
Control_DDR3_A.RESET_N: Soc_SmartFusion2 (U16.E15), Mem_IS43TR16256A (R20.1 U400.T2)
Control_DDR3_A.WE_N: Soc_SmartFusion2 (U16.G14), Mem_IS43TR16256A (U400.L3)
DAT0: Soc_SmartFusion2 (U16.J19), MTFC32GAPALBH (R26.2 U401.A3)
DAT1: Soc_SmartFusion2 (U16.H19), MTFC32GAPALBH (R27.2 U401.A4)
DAT2: Soc_SmartFusion2 (U16.G21), MTFC32GAPALBH (R29.2 U401.A5)
DAT3: Soc_SmartFusion2 (U16.G18), MTFC32GAPALBH (R30.2 U401.B2)
DAT4: Soc_SmartFusion2 (U16.G17), MTFC32GAPALBH (R32.2 U401.B3)
DAT5: Soc_SmartFusion2 (U16.G16), MTFC32GAPALBH (R33.2 U401.B4)
DAT6: Soc_SmartFusion2 (U16.F21), MTFC32GAPALBH (R34.2 U401.B5)
DAT7: Soc_SmartFusion2 (U16.F20), MTFC32GAPALBH (R35.2 U401.B6)
eMMC_CLK: Soc_SmartFusion2 (U16.H22), MTFC32GAPALBH (R25.2)
eMMC_CMD: Soc_SmartFusion2 (U16.H21), MTFC32GAPALBH (R28.1 U401.M5)
RST_N: Soc_SmartFusion2 (U16.F19), MTFC32GAPALBH (R31.2 U401.K5)